# Altium schematic sheet Top_Sheet.SchDoc
size 420 x 297 mm; DocumentNumber: 1; SheetNumber: 1; SheetTotal: 17
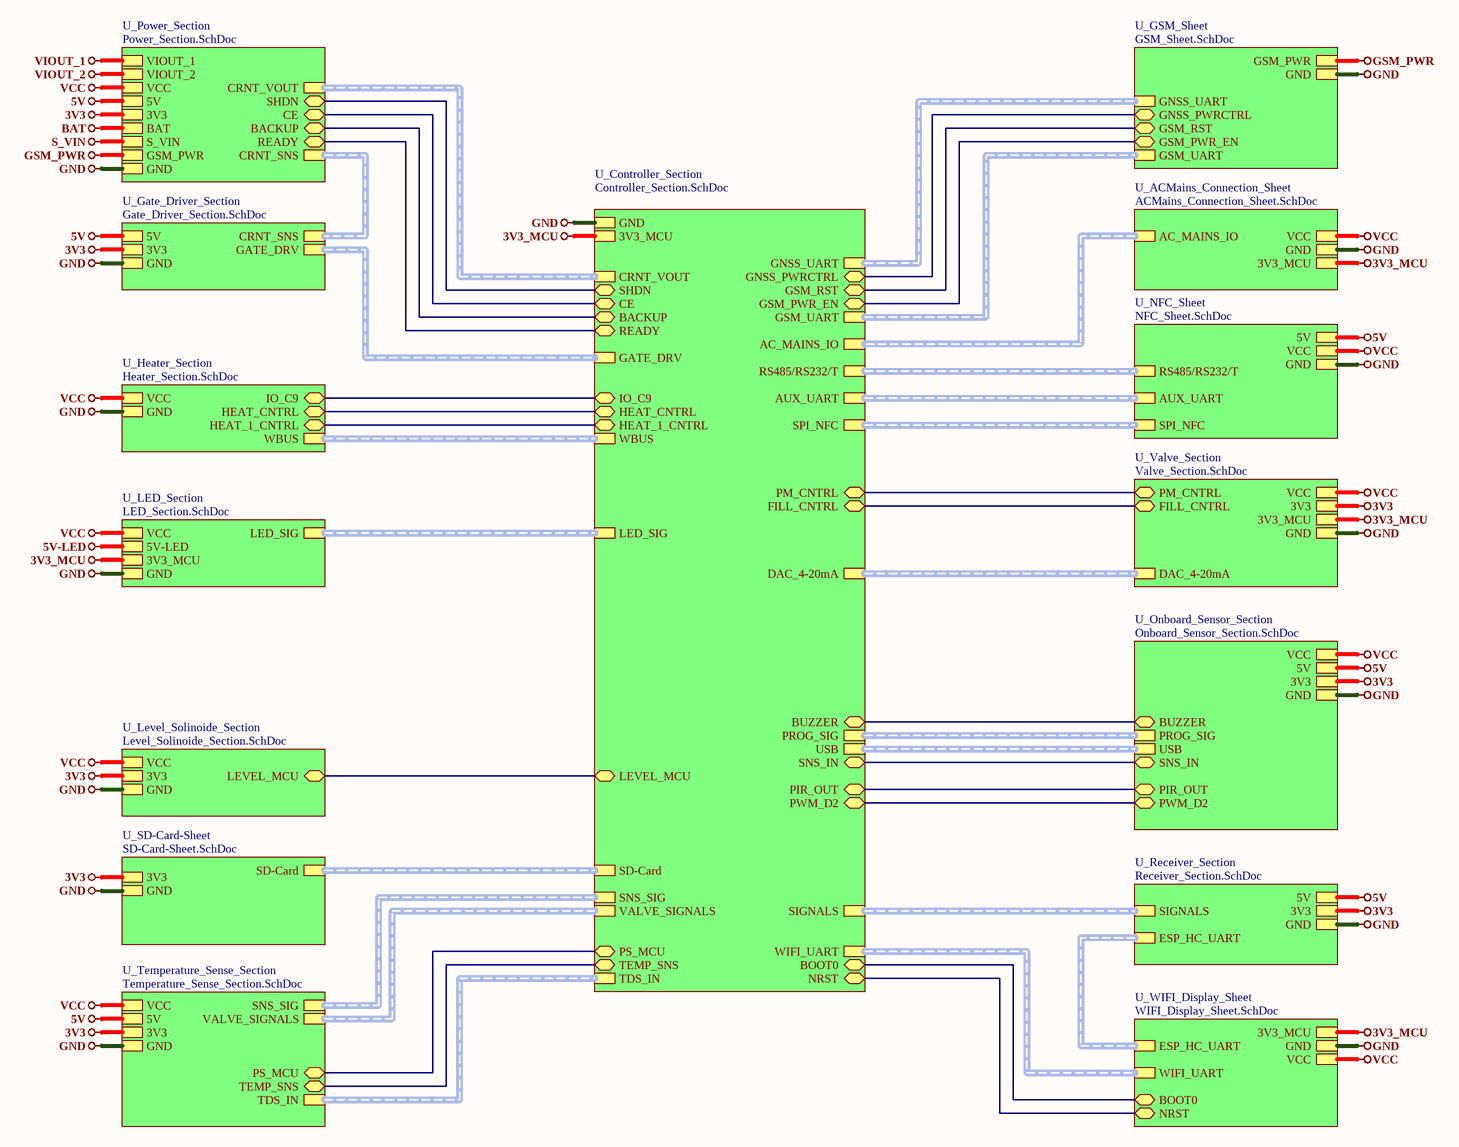
[diagram p0: Top_Sheet.SchDoc]

## Sub-sheets
U_ACMains_Connection_Sheet = ACMains_Connection_Sheet.SchDoc: GND, AC_MAINS_IO (harness ENCODER), VCC, 3V3_MCU
U_Controller_Section = Controller_Section.SchDoc: PROG_SIG (harness PROG_SIG), BUZZER (bidir), GATE_DRV (harness GATE_DRV), IO_C9 (bidir), GND, 3V3_MCU, SHDN (bidir), LED_SIG (harness LED_SIG), HEAT_CNTRL (bidir), SNS_IN (bidir), SIGNALS (harness RF_SIG), PIR_OUT (bidir), CRNT_VOUT (harness CRNT_VOUT), TDS_IN (harness TDS_IN), USB (harness USB), PWM_D2 (bidir), CE (bidir), AC_MAINS_IO (harness VALVE_SIGNALS), AUX_UART (harness VALVE_SIGNALS), GSM_UART (harness GSM_UART), GSM_PWR_EN (bidir), GSM_RST (bidir), TEMP_SNS (bidir), SPI_NFC (harness VALVE_SIGNALS), RS485/RS232/T (harness RS485/RS232/T), SD-Card (harness SD-Card), GNSS_PWRCTRL (bidir), READY (bidir), BACKUP (bidir), WIFI_UART (harness PROG_SIG), DAC_4-20mA (harness RF_SIG), BOOT0 (bidir), NRST (bidir), GNSS_UART (harness GSM_UART), WBUS (harness WBUS), HEAT_1_CNTRL (bidir), PS_MCU (bidir), SNS_SIG (harness SNS_SIG), LEVEL_MCU (bidir), VALVE_SIGNALS (harness VALVE_SIGNALS), PM_CNTRL (bidir), FILL_CNTRL (bidir)
U_Gate_Driver_Section = Gate_Driver_Section.SchDoc: GATE_DRV (harness GATE_DRV), 5V, GND, CRNT_SNS (harness CRNT_SNS), 3V3
U_GSM_Sheet = GSM_Sheet.SchDoc: GNSS_UART (harness PROG_SIG), GSM_PWR, GND, GSM_RST (bidir), GNSS_PWRCTRL (bidir), GSM_PWR_EN (bidir), GSM_UART (harness USB)
U_Heater_Section = Heater_Section.SchDoc: IO_C9 (bidir), VCC, GND, HEAT_CNTRL (bidir), WBUS (harness WBUS), HEAT_1_CNTRL (bidir)
U_LED_Section = LED_Section.SchDoc: LED_SIG (harness LED_SIG), VCC, GND, 5V-LED, 3V3_MCU
U_Level_Solinoide_Section = Level_Solinoide_Section.SchDoc: VCC, GND, 3V3, LEVEL_MCU (bidir)
U_NFC_Sheet = NFC_Sheet.SchDoc: 5V, GND, AUX_UART (harness HMI_UART), VCC, SPI_NFC (harness ENCODER), RS485/RS232/T (harness RS485/RS232/T)
U_Onboard_Sensor_Section = Onboard_Sensor_Section.SchDoc: PROG_SIG (harness PROG_SIG), BUZZER (bidir), VCC, 5V, 3V3, GND, SNS_IN (bidir), PIR_OUT (bidir), USB (harness USB), PWM_D2 (bidir)
U_Power_Section = Power_Section.SchDoc: VIOUT_1, VIOUT_2, VCC, 5V, 3V3, GND, CRNT_SNS (harness CRNT_SNS), SHDN (bidir), CRNT_VOUT (harness CRNT_VOUT), BAT, S_VIN, CE (bidir), GSM_PWR, BACKUP (bidir), READY (bidir)
U_Receiver_Section = Receiver_Section.SchDoc: SIGNALS (harness RF_SIG), 5V, GND, 3V3, ESP_HC_UART (harness PROG_SIG)
U_SD-Card-Sheet = SD-Card-Sheet.SchDoc: SD-Card (harness SD-Card), 3V3, GND
U_Temperature_Sense_Section = Temperature_Sense_Section.SchDoc: 5V, GND, 3V3, TDS_IN (harness TDS_IN), TEMP_SNS (bidir), VCC, PS_MCU (bidir), SNS_SIG (harness SNS_SIG), VALVE_SIGNALS (harness VALVE_SIGNALS)
U_Valve_Section = Valve_Section.SchDoc: VCC, GND, DAC_4-20mA (harness RF_SIG), 3V3, 3V3_MCU, PM_CNTRL (bidir), FILL_CNTRL (bidir)
U_WIFI_Display_Sheet = WIFI_Display_Sheet.SchDoc: 3V3_MCU, GND, WIFI_UART (harness PROG_SIG), NRST (bidir), BOOT0 (bidir), ESP_HC_UART (harness PROG_SIG), VCC

## Nets
3V3: sheet U_Power_Section/3V3, sheet U_Onboard_Sensor_Section/3V3, sheet U_Receiver_Section/3V3, sheet U_SD-Card-Sheet/3V3, sheet U_Valve_Section/3V3, sheet U_Temperature_Sense_Section/3V3, sheet U_Level_Solinoide_Section/3V3, sheet U_Gate_Driver_Section/3V3
3V3_MCU: sheet U_Controller_Section/3V3_MCU, sheet U_WIFI_Display_Sheet/3V3_MCU, sheet U_Valve_Section/3V3_MCU, sheet U_LED_Section/3V3_MCU, sheet U_ACMains_Connection_Sheet/3V3_MCU
5V: sheet U_Power_Section/5V, sheet U_Onboard_Sensor_Section/5V, sheet U_Receiver_Section/5V, sheet U_Temperature_Sense_Section/5V, sheet U_Gate_Driver_Section/5V, sheet U_NFC_Sheet/5V
5V-LED: sheet U_LED_Section/5V-LED
BAT: sheet U_Power_Section/BAT
GND: sheet U_Power_Section/GND, sheet U_Onboard_Sensor_Section/GND, sheet U_Receiver_Section/GND, sheet U_Controller_Section/GND, sheet U_SD-Card-Sheet/GND, sheet U_WIFI_Display_Sheet/GND, sheet U_Valve_Section/GND, sheet U_Temperature_Sense_Section/GND, sheet U_Level_Solinoide_Section/GND, sheet U_Gate_Driver_Section/GND, sheet U_LED_Section/GND, sheet U_NFC_Sheet/GND, sheet U_Heater_Section/GND, sheet U_GSM_Sheet/GND, sheet U_ACMains_Connection_Sheet/GND
GSM_PWR: sheet U_Power_Section/GSM_PWR, sheet U_GSM_Sheet/GSM_PWR
S_VIN: sheet U_Power_Section/S_VIN
VCC: sheet U_Power_Section/VCC, sheet U_Onboard_Sensor_Section/VCC, sheet U_WIFI_Display_Sheet/VCC, sheet U_Valve_Section/VCC, sheet U_Temperature_Sense_Section/VCC, sheet U_Level_Solinoide_Section/VCC, sheet U_LED_Section/VCC, sheet U_NFC_Sheet/VCC, sheet U_Heater_Section/VCC, sheet U_ACMains_Connection_Sheet/VCC
VIOUT_1: sheet U_Power_Section/VIOUT_1
VIOUT_2: sheet U_Power_Section/VIOUT_2
(unnamed): sheet U_Power_Section/SHDN, sheet U_Controller_Section/SHDN
(unnamed): sheet U_Power_Section/CE, sheet U_Controller_Section/CE
(unnamed): sheet U_Power_Section/BACKUP, sheet U_Controller_Section/BACKUP
(unnamed): sheet U_Power_Section/READY, sheet U_Controller_Section/READY
(unnamed): sheet U_Onboard_Sensor_Section/BUZZER, sheet U_Controller_Section/BUZZER
(unnamed): sheet U_Onboard_Sensor_Section/SNS_IN, sheet U_Controller_Section/SNS_IN
(unnamed): sheet U_Onboard_Sensor_Section/PIR_OUT, sheet U_Controller_Section/PIR_OUT
(unnamed): sheet U_Onboard_Sensor_Section/PWM_D2, sheet U_Controller_Section/PWM_D2
(unnamed): sheet U_Controller_Section/IO_C9, sheet U_Heater_Section/IO_C9
(unnamed): sheet U_Controller_Section/HEAT_CNTRL, sheet U_Heater_Section/HEAT_CNTRL
(unnamed): sheet U_Controller_Section/GSM_PWR_EN, sheet U_GSM_Sheet/GSM_PWR_EN
(unnamed): sheet U_Controller_Section/GSM_RST, sheet U_GSM_Sheet/GSM_RST
(unnamed): sheet U_Controller_Section/TEMP_SNS, sheet U_Temperature_Sense_Section/TEMP_SNS
(unnamed): sheet U_Controller_Section/GNSS_PWRCTRL, sheet U_GSM_Sheet/GNSS_PWRCTRL
(unnamed): sheet U_Controller_Section/BOOT0, sheet U_WIFI_Display_Sheet/BOOT0
(unnamed): sheet U_Controller_Section/NRST, sheet U_WIFI_Display_Sheet/NRST
(unnamed): sheet U_Controller_Section/HEAT_1_CNTRL, sheet U_Heater_Section/HEAT_1_CNTRL
(unnamed): sheet U_Controller_Section/PS_MCU, sheet U_Temperature_Sense_Section/PS_MCU
(unnamed): sheet U_Controller_Section/LEVEL_MCU, sheet U_Level_Solinoide_Section/LEVEL_MCU
(unnamed): sheet U_Controller_Section/PM_CNTRL, sheet U_Valve_Section/PM_CNTRL
(unnamed): sheet U_Controller_Section/FILL_CNTRL, sheet U_Valve_Section/FILL_CNTRL

## Buses and harness runs
harness sheet U_ACMains_Connection_Sheet/AC_MAINS_IO = sheet U_Controller_Section/AC_MAINS_IO
harness sheet U_Controller_Section/AUX_UART = sheet U_NFC_Sheet/AUX_UART
harness sheet U_Controller_Section/CRNT_VOUT = sheet U_Power_Section/CRNT_VOUT
harness sheet U_Controller_Section/DAC_4-20mA = sheet U_Valve_Section/DAC_4-20mA
harness sheet U_Controller_Section/GATE_DRV = sheet U_Gate_Driver_Section/GATE_DRV
harness sheet U_Controller_Section/GNSS_UART = sheet U_GSM_Sheet/GNSS_UART
harness sheet U_Controller_Section/GSM_UART = sheet U_GSM_Sheet/GSM_UART
harness sheet U_Controller_Section/LED_SIG = sheet U_LED_Section/LED_SIG
harness sheet U_Controller_Section/PROG_SIG = sheet U_Onboard_Sensor_Section/PROG_SIG
harness sheet U_Controller_Section/RS485/RS232/T = sheet U_NFC_Sheet/RS485/RS232/T
harness sheet U_Controller_Section/SD-Card = sheet U_SD-Card-Sheet/SD-Card
harness sheet U_Controller_Section/SIGNALS = sheet U_Receiver_Section/SIGNALS
harness sheet U_Controller_Section/SNS_SIG = sheet U_Temperature_Sense_Section/SNS_SIG
harness sheet U_Controller_Section/SPI_NFC = sheet U_NFC_Sheet/SPI_NFC
harness sheet U_Controller_Section/TDS_IN = sheet U_Temperature_Sense_Section/TDS_IN
harness sheet U_Controller_Section/USB = sheet U_Onboard_Sensor_Section/USB
harness sheet U_Controller_Section/VALVE_SIGNALS = sheet U_Temperature_Sense_Section/VALVE_SIGNALS
harness sheet U_Controller_Section/WBUS = sheet U_Heater_Section/WBUS
harness sheet U_Controller_Section/WIFI_UART = sheet U_WIFI_Display_Sheet/WIFI_UART
harness sheet U_Gate_Driver_Section/CRNT_SNS = sheet U_Power_Section/CRNT_SNS
harness sheet U_Receiver_Section/ESP_HC_UART = sheet U_WIFI_Display_Sheet/ESP_HC_UART

## Notes on the sheet
- File:
- Title:
- Date:
- Page
- Num:
- Total:
- Drawn By: Huzaifa Ali